# Altium project P2_OBC-ADCS CubeSat - Copy.PrjPcb (part 2 of 2)

## Sheet  CAM_IF.SchDoc
size A4; SheetNumber: 5; SheetTotal: 9
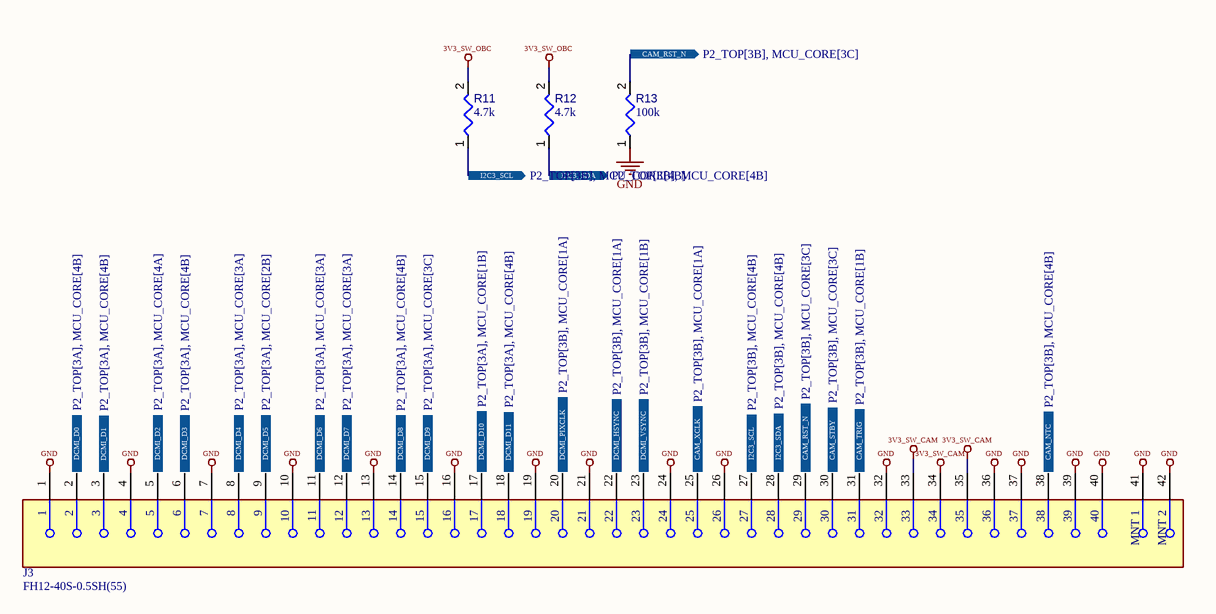
[diagram p4:  CAM_IF.SchDoc]

### Parts
J3  FH12-40S-0.5SH(55)  [FP-FH12-40S-0_5SH_55-MFG]
R11  value 4.7k  [RESC0402(1005)_L]  (hidden comment: Resistor 4K7  +/-1 % 0402 63 mW)
R12  value 4.7k  [RESC0402(1005)_L]  (hidden comment: Resistor 4K7  +/-1 % 0402 63 mW)
R13  value 100k  [RESC1005X40X25ML05T05]  (hidden comment: Resistor 100k +/-1% 0402 100 mW)

### Ports
CAM_NTC (out, see P2_TOP[3B], MCU_CORE[4B]), CAM_RST_N (out, see P2_TOP[3B], MCU_CORE[3C]), CAM_STBY (out, see P2_TOP[3B], MCU_CORE[3C]), CAM_TRIG (out, see P2_TOP[3B], MCU_CORE[1B]), CAM_XCLK (out, see P2_TOP[3B], MCU_CORE[1A]), DCMI_D0 (out, see P2_TOP[3A], MCU_CORE[4B]), DCMI_D1 (out, see P2_TOP[3A], MCU_CORE[4B]), DCMI_D2 (out, see P2_TOP[3A], MCU_CORE[4A]), DCMI_D3 (out, see P2_TOP[3A], MCU_CORE[4B]), DCMI_D4 (out, see P2_TOP[3A], MCU_CORE[3A]), DCMI_D5 (out, see P2_TOP[3A], MCU_CORE[2B]), DCMI_D6 (out, see P2_TOP[3A], MCU_CORE[3A]), DCMI_D7 (out, see P2_TOP[3A], MCU_CORE[3A]), DCMI_D8 (out, see P2_TOP[3A], MCU_CORE[4B]), DCMI_D9 (out, see P2_TOP[3A], MCU_CORE[3C]), DCMI_D10 (out, see P2_TOP[3A], MCU_CORE[1B]), DCMI_D11 (out, see P2_TOP[3A], MCU_CORE[4B]), DCMI_HSYNC (out, see P2_TOP[3B], MCU_CORE[1A]), DCMI_PIXCLK (out, see P2_TOP[3B], MCU_CORE[1A]), DCMI_VSYNC (out, see P2_TOP[3B], MCU_CORE[1B]), I2C3_SCL (out, see P2_TOP[3B], MCU_CORE[4B]), I2C3_SDA (out, see P2_TOP[3B], MCU_CORE[4B])

### Nets
3V3_SW_CAM: J3.33 J3.34 J3.35
3V3_SW_OBC: R11.2 R12.2
GND: J3.1 J3.4 J3.7 J3.10 J3.13 J3.16 J3.19 J3.21 J3.24 J3.26 J3.32 J3.36 J3.37 J3.39 J3.40 J3.41(MNT_1) J3.42(MNT_2) R13.1
NetJ3_2: J3.2 ; port DCMI_D0
NetJ3_3: J3.3 ; port DCMI_D1
NetJ3_5: J3.5 ; port DCMI_D2
NetJ3_6: J3.6 ; port DCMI_D3
NetJ3_8: J3.8 ; port DCMI_D4
NetJ3_9: J3.9 ; port DCMI_D5
NetJ3_11: J3.11 ; port DCMI_D6
NetJ3_12: J3.12 ; port DCMI_D7
NetJ3_14: J3.14 ; port DCMI_D8
NetJ3_15: J3.15 ; port DCMI_D9
NetJ3_17: J3.17 ; port DCMI_D10
NetJ3_18: J3.18 ; port DCMI_D11
NetJ3_20: J3.20 ; port DCMI_PIXCLK
NetJ3_22: J3.22 ; port DCMI_HSYNC
NetJ3_23: J3.23 ; port DCMI_VSYNC
NetJ3_25: J3.25 ; port CAM_XCLK
NetJ3_27: J3.27 R11.1 ; port I2C3_SCL
NetJ3_28: J3.28 R12.1 ; port I2C3_SDA
NetJ3_29: J3.29 R13.2 ; port CAM_RST_N
NetJ3_30: J3.30 ; port CAM_STBY
NetJ3_31: J3.31 ; port CAM_TRIG
NetJ3_38: J3.38 ; port CAM_NTC

### Library data of the parts
J3 = CMP-002-00080-1: FFC/FPC Connectors; FH12-40S-0.5SH(55); HIROSE ELECTRIC; 500 mA; Yes; Gold; 40; Connector Type: Receptacle; Number of Positions: 40; Current Rating: 500mA; Contact Resistance: 50mΩ; Max Voltage Rating (AC): 50V; Gender: Female; Pitch: 508µm; Contact Pitch: 500µm; Plating Thickness: 50.8nm; Dielectric Material: Polyamide; Insulation Resistance: 500MΩ; Actuator Material: Polyphenylene; Wire/Cable Type: Straight; Max Current Rating: 400mA; Contact Location: Bottom; Number of Rows: 1; Min Operating Temperature: -40°C; Termination: Solder; Terminal Pitch: 500µm; Lifecycle Status: Production; Max Operating Temperature: 85°C; RoHS: Compliant; Contact Material: Gold, Nickel; Flammability Rating: UL94 V-0; Pins: 40; Lead Free: Lead Free; Mounting Technology: Surface Mount; Contact Voltage Rating (AC): 50V; Height: 2mm; Voltage Rating: 50V; Housing Color: Brown; Voltage Rating (AC): 50V; Orientation: Right Angle; Packaging: Cut Tape; Contact Plating: Gold; Color: Beige, Brown; Width: 6.4mm; REACH SVHC: Unaffected; Insulation Material: Nylon; Length: 24.1mm; Depth: 5.6mm; Lead Pitch: 500µm; Number of Contacts: 40
R11 R12 = CMP-009-00158-3: Chip Resistor, 4,7 kOhms, +/-1 %, 63 mW, -55 to 155 degC, 0402; Power: 63mW; Tolerance: 1%; Max Operating Temperature: 155°C; Pins: 2; Min Operating Temperature: -55°C; Case/Package: 0402
R13 = CMP-009-00022-5: Chip Resistor, 100 KOhm, +/- 1%, 0.1 W, -55 to 155 degC, 0402 (1005 Metric); Power: 100mW; Voltage Rating: 50V; Mounting Technology: SM; Pins: 2; Min Operating Temperature: -55°C; Tolerance: 1%; RoHS Compliant: True; Case/Package: 0402; Max Operating Temperature: 155°C

## Sheet  ADCS_SENS.SchDoc
size A4; SheetNumber: 6; SheetTotal: 9
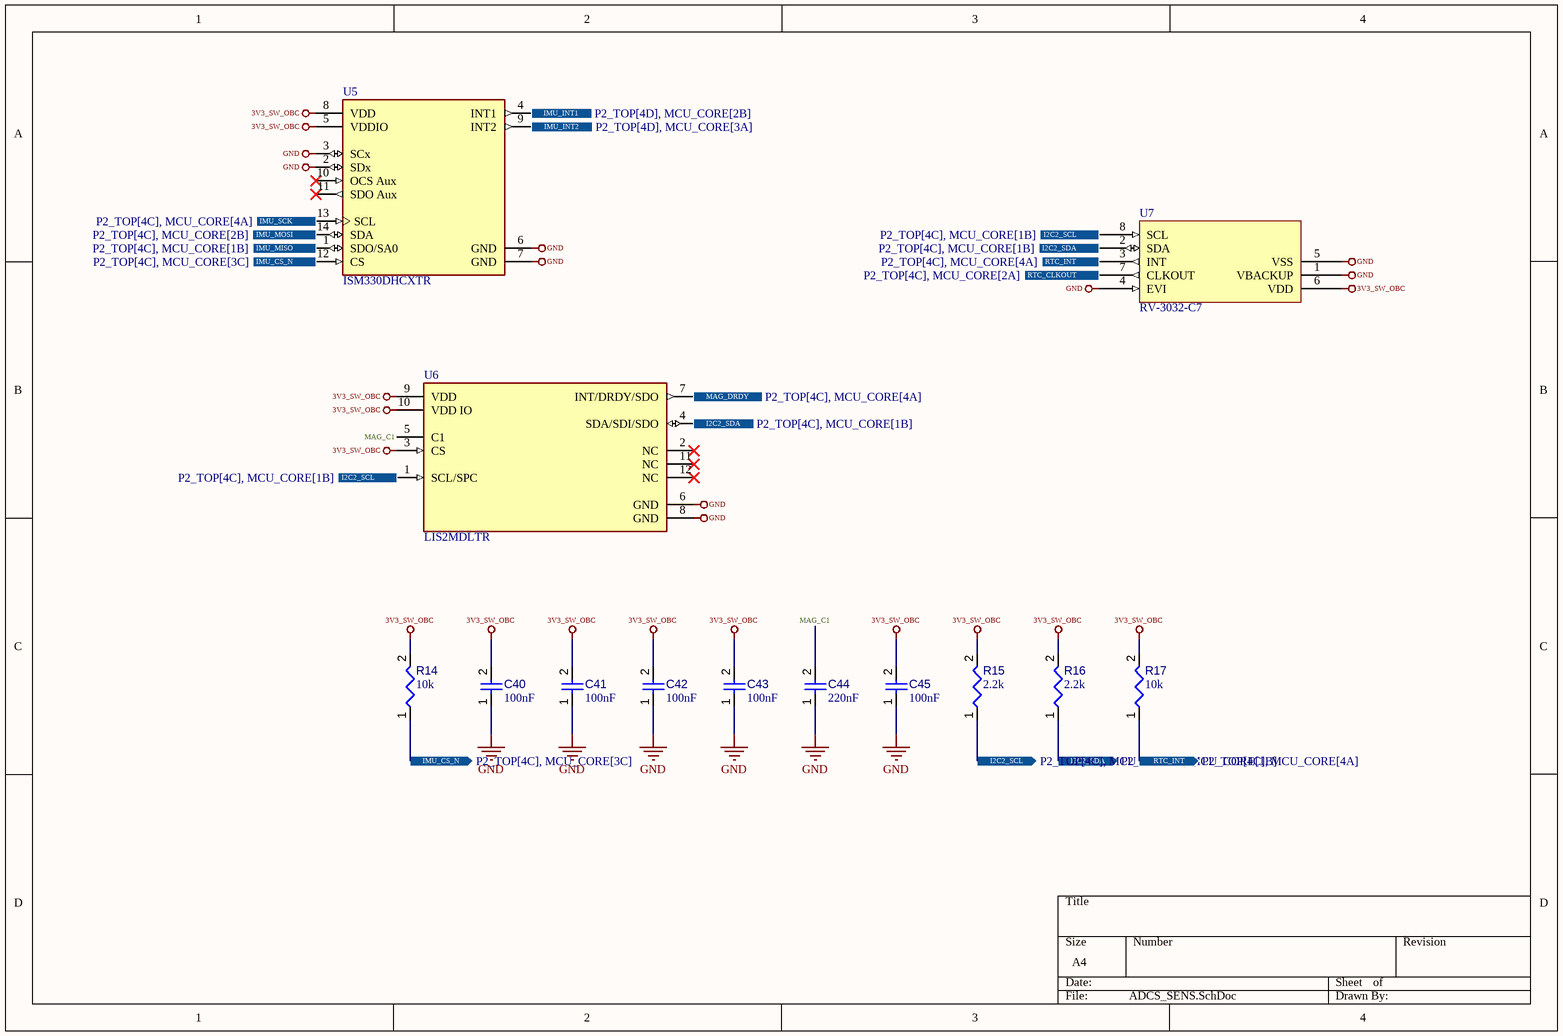
[diagram p5:  ADCS_SENS.SchDoc]

### Parts
C40  value 100nF  [CAPC0402(1005)60_L]  (hidden comment: Capacitor 100nF +/-20% 10V 0402)
C41  value 100nF  [CAPC0402(1005)60_L]  (hidden comment: Capacitor 100nF +/-20% 10V 0402)
C42  value 100nF  [CAPC0402(1005)60_L]  (hidden comment: Capacitor 100nF +/-20% 10V 0402)
C43  value 100nF  [CAPC0402(1005)60_L]  (hidden comment: Capacitor 100nF +/-20% 10V 0402)
C44  value 220nF  [CAPC0402(1005)60_L]  (hidden comment: Capacitor 220nF +/-20% 10V 0402)
C45  value 100nF  [CAPC0402(1005)60_L]  (hidden comment: Capacitor 100nF +/-20% 10V 0402)
R14  value 10k  [RESC1005X40X25ML05T05]  (hidden comment: Resistor 10k +/-1% 0402 63 mW)
R15  value 2.2k  [RESC0402(1005)_L]  (hidden comment: Resistor 2K2  +/-5 % 0402 63 mW)
R16  value 2.2k  [RESC0402(1005)_L]  (hidden comment: Resistor 2K2  +/-5 % 0402 63 mW)
R17  value 10k  [RESC1005X40X25ML05T05]  (hidden comment: Resistor 10k +/-1% 0402 63 mW)
U5  ISM330DHCXTR  [FP-LGA-14L-DM00249496-MFG]
U6  LIS2MDLTR  [FP-LGA-12-DM00170568-MFG]
U7  RV-3032-C7  [RV-3032-C7-Footprint-1]

### Ports
I2C2_SCL (out, see P2_TOP[4C], MCU_CORE[1B]), I2C2_SDA (out, see P2_TOP[4C], MCU_CORE[1B]), IMU_CS_N (out, see P2_TOP[4C], MCU_CORE[3C]), IMU_INT1 (out, see P2_TOP[4D], MCU_CORE[2B]), IMU_INT2 (out, see P2_TOP[4D], MCU_CORE[3A]), IMU_MISO (out, see P2_TOP[4C], MCU_CORE[1B]), IMU_MOSI (out, see P2_TOP[4C], MCU_CORE[2B]), IMU_SCK (out, see P2_TOP[4C], MCU_CORE[4A]), MAG_DRDY (out, see P2_TOP[4C], MCU_CORE[4A]), RTC_CLKOUT (out, see P2_TOP[4C], MCU_CORE[2A]), RTC_INT (out, see P2_TOP[4C], MCU_CORE[4A])

### Nets
3V3_SW_OBC: C40.2 C41.2 C42.2 C43.2 C45.2 R14.2 R15.2 R16.2 R17.2 U5.5(VDDIO) U5.8(VDD) U6.3(CS) U6.9(VDD) U6.10(VDD_IO) U7.6(VDD)
GND: C40.1 C41.1 C42.1 C43.1 C44.1 C45.1 U5.2(SDx) U5.3(SCx) U5.6(GND) U5.7(GND) U6.6(GND) U6.8(GND) U7.1(VBACKUP) U7.4(EVI) U7.5(VSS)
MAG_C1: C44.2 U6.5(C1)
NetR14_1: R14.1 U5.12(CS) ; port IMU_CS_N
NetR15_1: R15.1 U6.1(SCL/SPC) U7.8(SCL) ; port I2C2_SCL
NetR16_1: R16.1 U6.4(SDA/SDI/SDO) U7.2(SDA) ; port I2C2_SDA
NetR17_1: R17.1 U7.3(INT) ; port RTC_INT
NetU5_1: U5.1(SDO/SA0) ; port IMU_MISO
NetU5_4: U5.4(INT1) ; port IMU_INT1
NetU5_9: U5.9(INT2) ; port IMU_INT2
NetU5_13: U5.13(SCL) ; port IMU_SCK
NetU5_14: U5.14(SDA) ; port IMU_MOSI
NetU6_7: U6.7(INT/DRDY/SDO) ; port MAG_DRDY
NetU7_7: U7.7(CLKOUT) ; port RTC_CLKOUT

Not connected (* = marked no-connect by the designer): U5 10(OCS_Aux)* 11(SDO_Aux)*; U6 2(NC)* 11(NC)* 12(NC)*

### Library data of the parts
C40-C43 C45 = CMP-001-00061-3: Chip Capacitor, 100nF +/-20%, 10V, 0402, Thickness 0.6 mm; Tolerance: 20%; Mounting Technology: SMT; Voltage Rating: 10V; Max Operating Temperature: 85°C; Pins: 2; Case/Package: 0402; Min Operating Temperature: -55°C
C44 = CMP-001-00057-3: Chip Capacitor, 220nF +/-20%, 10V, 0402, Thickness 0.6 mm; Tolerance: 10%; Max Operating Temperature: 85°C; Pins: 2; Case/Package: 0402; Mounting Technology: SMT; Voltage Rating: 10V; Min Operating Temperature: -55°C
R14 R17 = CMP-009-00019-5: Chip Resistor, 10 KOhm, +/- 1%, 63 mW, -55 to 155 degC, 0402 (1005 Metric); Power: 63mW; Voltage Rating: 50V; Case/Package: 0402; Mounting Technology: SM; Pins: 2; Min Operating Temperature: -55°C; Tolerance: 1%; RoHS Compliant: True; Max Operating Temperature: 155°C
R15 R16 = CMP-009-00166-3: Chip Resistor, 2,2 kOhms, +/-5 %, 63 mW, -55 to 155 degC, 0402; Power: 63mW; Tolerance: 5%; Pins: 2; Min Operating Temperature: -55°C; Max Operating Temperature: 155°C; Case/Package: 0402
U5 = CMP-010-00024-2: MEMS Module, Tri-Axis Gyroscope, Tri-Axis Accelerometer, 1.71 V, 3.6 V, LGA, 14 Pins; Output Configuration: Digital; Max Supply Voltage: 3.6V; Min Supply Voltage: 1.71V; Operating Supply Voltage: 1.8V; RoHS: Compliant; Lifecycle Status: Production; REACH SVHC: Unaffected; Output Type: Digital; Max Operating Temperature: 105°C; Min Operating Temperature: -40°C; Length: 3mm; Number of Terminals: 14; Country of Origin: Philippines; Mounting Technology: Surface Mount; China RoHS: Non-Compliant; Export Control Classification Number (ECCN) Code: EAR99; Height: 860µm; Introduction Date: 2019-07-31
U6 = CMP-010-00026-2: LIS2MDL Series 3.6V 50 Hz High Performance 3-Axis Digital Magnetic Sensor-LGA-12; Manufacturer Package Identifier: LGA-12-DM00170568; Axis: X, Y, Z; Operating Supply Voltage: 2.5V; Current Rating: 200µA; Min Supply Voltage: 1.71V; Min Operating Temperature: -40°C; Output Type: Digital; Max Supply Voltage: 3.6V; Country of Origin: Malta; Height: 700µm; Termination: Solder; Schedule B: 8542390000, 8542390000; Length: 2mm; Mounting Technology: Surface Mount; Export Control Classification Number (ECCN) Code: EAR99; Max Operating Temperature: 85°C; Introduction Date: 2017-05-12; China RoHS: Compliant; Sensing Method: Magnetic; Number of Terminals: 12; RoHS: Compliant; REACH SVHC: Unaffected; Lifecycle Status: Production
U7 = CMP-003-00032-2: Real Time Clock, Non-Volatile, 0 Timer(s), CMOS, CDSO8; Min Supply Voltage: 1.3V; Number of Timers/Counters: 0; Body Material: Ceramic; Nominal Supply Voltage (DC): 3V; Max Supply Voltage: 5.5V; Max Operating Temperature: 85°C; Length: 3.2mm; Height - Seated (Max): 800µm; Contact Plating: Gold; Lifecycle Status: Production; Ratings: AEC-Q200; China RoHS: Compliant; Terminal Pitch: 900µm; Width: 1.5mm; Number of Terminals: 8; RoHS: Compliant; REACH SVHC: Unaffected; Min Operating Temperature: -40°C

## Sheet  BUS_IF.SchDoc
size A4; SheetNumber: 7; SheetTotal: 9
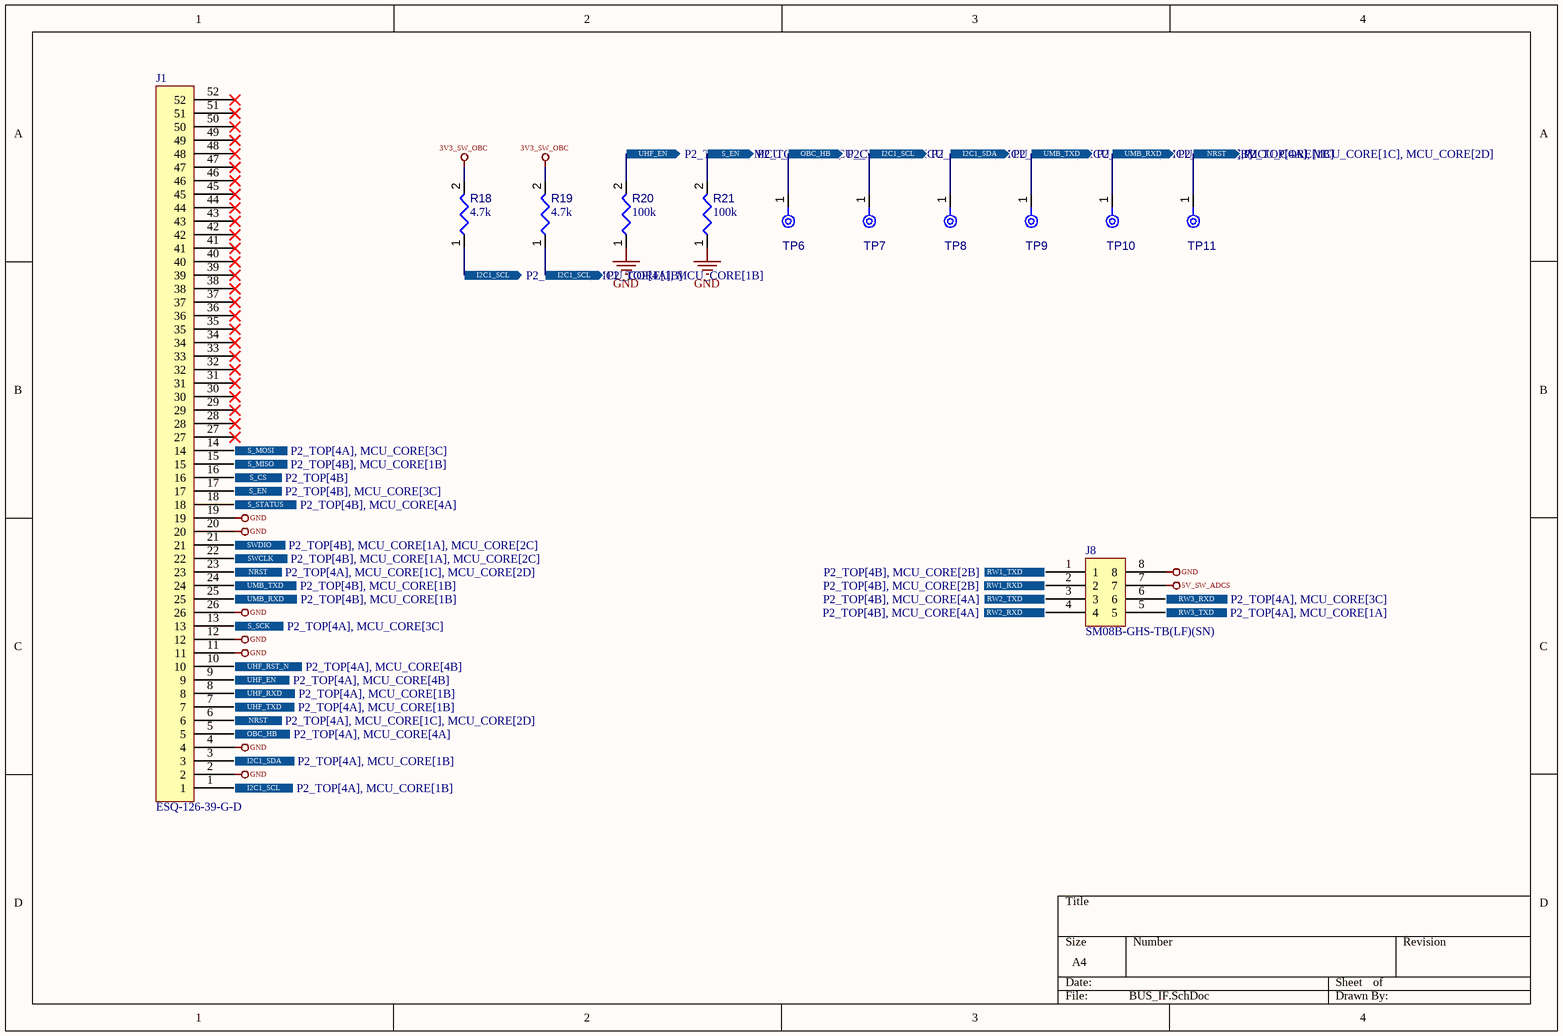
[diagram p6:  BUS_IF.SchDoc]

### Parts
(Parts that share a designator on the sheet are numbered #1, #2 ... from top to bottom, then left to right.)
J1#1  ESQ-126-39-G-D  [CONN_ESQ-126-39-G-D_SAI]
J8  SM08B-GHS-TB(LF)(SN)
R18  value 4.7k  [RESC0402(1005)_L]  (hidden comment: Resistor 4K7  +/-1 % 0402 63 mW)
R19  value 4.7k  [RESC0402(1005)_L]  (hidden comment: Resistor 4K7  +/-1 % 0402 63 mW)
R20  value 100k  [RESC0402(1005)_L]  (hidden comment: 100KR2F)
R21  value 100k  [RESC0402(1005)_L]  (hidden comment: 100KR2F)
TP6  TPAD6R  [TP06R]  (value not drawn)  (no BOM)
TP7  TPAD6R  [TP06R]  (value not drawn)  (no BOM)
TP8  TPAD6R  [TP06R]  (value not drawn)  (no BOM)
TP9  TPAD6R  [TP06R]  (value not drawn)  (no BOM)
TP10  TPAD6R  [TP06R]  (value not drawn)  (no BOM)
TP11  TPAD6R  [TP06R]  (value not drawn)  (no BOM)

### Ports
I2C1_SCL (out, see P2_TOP[4A], MCU_CORE[1B]), I2C1_SDA (out, see P2_TOP[4A], MCU_CORE[1B]), NRST (out, see P2_TOP[4A], MCU_CORE[1C], MCU_CORE[2D]), OBC_HB (out, see P2_TOP[4A], MCU_CORE[4A]), RW1_RXD (out, see P2_TOP[4B], MCU_CORE[2B]), RW1_TXD (out, see P2_TOP[4B], MCU_CORE[2B]), RW2_RXD (out, see P2_TOP[4B], MCU_CORE[4A]), RW2_TXD (out, see P2_TOP[4B], MCU_CORE[4A]), RW3_RXD (out, see P2_TOP[4A], MCU_CORE[3C]), RW3_TXD (out, see P2_TOP[4A], MCU_CORE[1A]), S_CS (out, see P2_TOP[4B]), S_EN (out, see P2_TOP[4B], MCU_CORE[3C]), S_MISO (out, see P2_TOP[4B], MCU_CORE[1B]), S_MOSI (out, see P2_TOP[4A], MCU_CORE[3C]), S_SCK (out, see P2_TOP[4A], MCU_CORE[3C]), S_STATUS (out, see P2_TOP[4B], MCU_CORE[4A]), SWCLK (out, see P2_TOP[4B], MCU_CORE[1A], MCU_CORE[2C]), SWDIO (out, see P2_TOP[4B], MCU_CORE[1A], MCU_CORE[2C]), UHF_EN (out, see P2_TOP[4A], MCU_CORE[4B]), UHF_RST_N (out, see P2_TOP[4A], MCU_CORE[4B]), UHF_RXD (out, see P2_TOP[4A], MCU_CORE[1B]), UHF_TXD (out, see P2_TOP[4A], MCU_CORE[1B]), UMB_RXD (out, see P2_TOP[4B], MCU_CORE[1B]), UMB_TXD (out, see P2_TOP[4B], MCU_CORE[1B])

### Nets
3V3_SW_OBC: R18.2 R19.2
5V_SW_ADCS: J8.7
GND: J1#1.2 J1#1.4 J1#1.11 J1#1.12 J1#1.19 J1#1.20 J1#1.26 J8.8 R20.1 R21.1
NetJ1#1_1: J1#1.1 R18.1 R19.1 TP7.1(TP) ; port I2C1_SCL
NetJ1#1_3: J1#1.3 TP8.1(TP) ; port I2C1_SDA
NetJ1#1_5: J1#1.5 TP6.1(TP) ; port OBC_HB
NetJ1#1_6: J1#1.6 J1#1.23 TP11.1(TP) ; port NRST
NetJ1#1_7: J1#1.7 ; port UHF_TXD
NetJ1#1_8: J1#1.8 ; port UHF_RXD
NetJ1#1_9: J1#1.9 R20.2 ; port UHF_EN
NetJ1#1_10: J1#1.10 ; port UHF_RST_N
NetJ1#1_13: J1#1.13 ; port S_SCK
NetJ1#1_14: J1#1.14 ; port S_MOSI
NetJ1#1_15: J1#1.15 ; port S_MISO
NetJ1#1_16: J1#1.16 ; port S_CS
NetJ1#1_17: J1#1.17 R21.2 ; port S_EN
NetJ1#1_18: J1#1.18 ; port S_STATUS
NetJ1#1_21: J1#1.21 ; port SWDIO
NetJ1#1_22: J1#1.22 ; port SWCLK
NetJ1#1_24: J1#1.24 TP9.1(TP) ; port UMB_TXD
NetJ1#1_25: J1#1.25 TP10.1(TP) ; port UMB_RXD
NetJ8_1: J8.1 ; port RW1_TXD
NetJ8_2: J8.2 ; port RW1_RXD
NetJ8_3: J8.3 ; port RW2_TXD
NetJ8_4: J8.4 ; port RW2_RXD
NetJ8_5: J8.5 ; port RW3_TXD
NetJ8_6: J8.6 ; port RW3_RXD

Not connected (* = marked no-connect by the designer): J1#1 27* 28* 29* 30* 31* 32* 33* 34* 35* 36* 37* 38* 39* 40* 41* 42* 43* 44* 45* 46* 47* 48* 49* 50* 51* 52*

### Library data of the parts
J1#1 = CMP-002-00077-3: Samtec ESQ Series, 2.54mm Pitch, 52-Pin Double Row Receptacle, Board-to-Board, Right Angle, TH; Manufacturer Lifecycle Status: PRODUCTION; Max Voltage Rating (AC): 550V; Contact Resistance: 10mΩ; Number of Contacts: 52; Max Current Rating: 6.9A; Housing Color: Black; Max Operating Temperature: 125°C; Depth: 4.95mm; Radiation Hardening: No; RoHS: Compliant; Housing Material: Polyester; Pitch: 2.54mm; Number of Rows: 2; Orientation: Straight; Length: 66.55mm; Lifecycle Status: Production; Packaging: Bulk; Contact Plating: Gold; Termination: Solder; Pins: 52; Min Operating Temperature: -55°C; Contact Material: Bronze
J8 = CMP-002-00081-2: Connector Header Surface Mount, Right Angle 8 position 0.049" (1.25mm); Voltage Rating: 50V; Contact Resistance: 50mΩ; Gender: Male; Number of Contacts: 8; Current Rating: 1A; Pitch: 1.2446mm; Insulation Resistance: 100MΩ; Connector Type: Male Pin, Outer Shroud Contact; Dielectric Material: Polyamide; Orientation: Right Angle; Max Operating Temperature: 85°C; Contact Material: Copper, Tin; Contact Plating: Tin; Pins: 8; Lifecycle Status: Production; Min Operating Temperature: -25°C; Number of Rows: 1; Housing Color: Natural; REACH SVHC: Unaffected; Termination: Solder; Manufacturer Package Identifier: SM08B-GHS-TB(LF)(SN); Height: 4.35mm; Housing Material: Nylon; Fastening Type: Latch, Ramp; Number of Positions: 8; RoHS: Compliant; Lead Free: Lead Free; Terminal Pitch: 1.25mm; Color: Natural; Mounting Technology: Surface Mount
R18 R19 = CMP-009-00158-3: Chip Resistor, 4,7 kOhms, +/-1 %, 63 mW, -55 to 155 degC, 0402; Power: 63mW; Tolerance: 1%; Max Operating Temperature: 155°C; Pins: 2; Min Operating Temperature: -55°C; Case/Package: 0402
R20 R21 = CMP-009-00064-2: 100K 0.063W 1% 0402 (1005 Metric)  SMD; Power: 63mW; Case/Package: 0402; Mounting Technology: SMT; Pins: 2; Tolerance: 1%
TP6-TP11 = CMP-00028-00002-2: 0.6mm round; Pins: 1

## Sheet  MTQ_CH.SchDoc
size A4; SheetNumber: 8; SheetTotal: 9
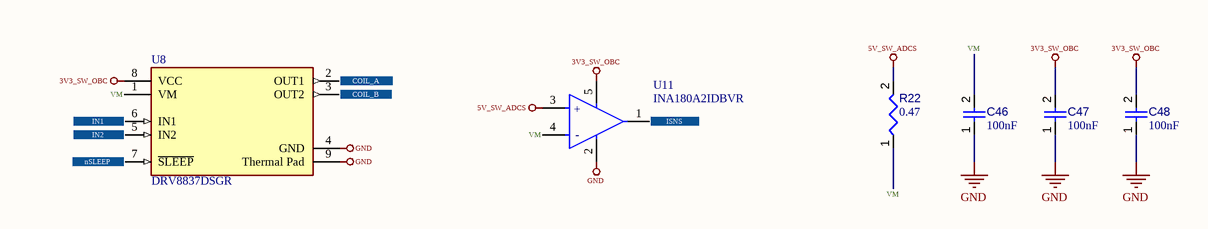
[diagram p7:  MTQ_CH.SchDoc]

### Parts
C46  value 100nF  [CAPC0402(1005)60_L]  (hidden comment: Capacitor 100nF +/-20% 25V 0402)
C47  value 100nF  [CAPC0402(1005)60_L]  (hidden comment: Capacitor 100nF +/-20% 25V 0402)
C48  value 100nF  [CAPC0402(1005)60_L]  (hidden comment: Capacitor 100nF +/-20% 25V 0402)
R22  value 0.47  [RESC1608X55X25ML10T15]  (hidden comment: Resistor 4k7 +/-1% 0603 100 mW)
U8  DRV8837DSGR  [FP-DSG0008A-IPC_A]
U11  INA180A2IDBVR  [FP-DBV0005A-IPC_B]

### Ports
COIL_A (out), COIL_B (out), IN1 (out), IN2 (out), ISNS (out), nSLEEP (out)

### Nets
3V3_SW_OBC: C47.2 C48.2 U8.8(VCC) U11.5(VS)
5V_SW_ADCS: R22.2 U11.3(IN+)
GND: C46.1 C47.1 C48.1 U8.4(GND) U8.9(Thermal_Pad) U11.2(GND)
VM: C46.2 R22.1 U8.1(VM) U11.4(IN-)
NetU8_2: U8.2(OUT1) ; port COIL_A
NetU8_3: U8.3(OUT2) ; port COIL_B
NetU8_5: U8.5(IN2) ; port IN2
NetU8_6: U8.6(IN1) ; port IN1
NetU8_7: U8.7(~{SLEEP}) ; port nSLEEP
NetU11_1: U11.1(OUT) ; port ISNS

### Library data of the parts
C46-C48 = CMP-001-00065-4: Chip Capacitor, 100nF +/-20%, 25V, 0402, Thickness 0.6 mm; Tolerance: 10%; Max Operating Temperature: 85°C; Min Operating Temperature: -55°C; Pins: 2; Voltage Rating: 25V; Mounting Technology: SMT; Case/Package: 0402
R22 = CMP-009-00031-5: Chip Resistor, 4.7 KOhm, +/- 1%, 0.1 W, -55 to 155 degC, 0603 (1608 Metric); Power: 100mW; Tolerance: 1%; Mounting Technology: SM; Case/Package: 0603; RoHS Compliant: True; Pins: 2; Min Operating Temperature: -55°C; Max Operating Temperature: 155°C
U8 = CMP-00024-00006-1: 12-V, 1.8-A H-bridge motor driver 8-WSON -40 to 85; Manufacturer Lifecycle Status: ACTIVE; Max Output current: 1.8A; Motor Type: Brushed; Number of Outputs: 2; Number of Channels: 1; Nominal Supply Current: 300µA; Fault Protection: Over Temperature, Short Circuit; Max Supply Voltage: 7V; Max Junction Temperature (Tj): 150°C; Min Supply Voltage: 1.8V; Pins: 8; Thickness: 750µm; Mounting Technology: Surface Mount; Min Operating Temperature: -40°C; Type: Integrated Circuit (IC); Schedule B: 8542390000, 8542390000; REACH SVHC: Unaffected; Height: 800µm; RoHS: Compliant; Output Current: 1.8A; Length: 2mm; Ambient Temperature Range High: 85°C; Lifecycle Status: Production; Lead Free: Lead Free; Max Operating Temperature: 85°C; Radiation Hardening: No; Width: 2mm
U11 = CMP-014-00002-1: IC CURR SENSE 1 CIRCUIT SOT23-5 / Current Sense Amplifier 1 Circuit Rail-to-Rail SOT-23-5; Manufacturer Lifecycle Status: ACTIVE; Nominal Supply Current: 197µA; Number of Channels: 1; Max Junction Temperature (Tj): 150°C; Input Bias Current: 80µA; Input Offset Voltage (Vos): 100µV; Bandwidth: 210kHz; Max Supply Voltage: 5.5V; Min Supply Voltage: 2.7V; Output Current per Channel: 8mA; Min Operating Temperature: -40°C; Width: 1.6mm; Thickness: 1.2mm; Schedule B: 8542330000, 8542330000; Height: 1.45mm; Case/Package: SOT-23; Ambient Temperature Range High: 125°C; RoHS: Compliant; Pins: 5; Lifecycle Status: Production; Length: 2.9mm; Max Operating Temperature: 125°C

## Sheet  PANEL_CH.SchDoc
size A4; SheetNumber: 9; SheetTotal: 9
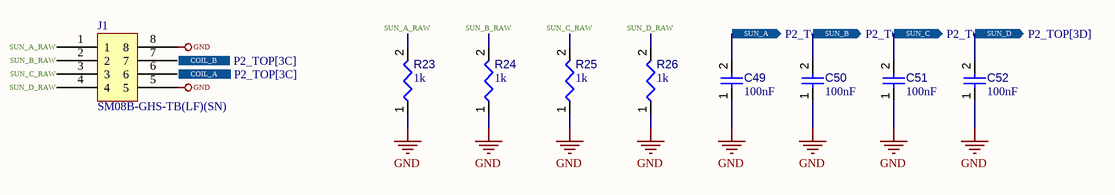
[diagram p8:  PANEL_CH.SchDoc]

### Parts
(Parts that share a designator on the sheet are numbered #1, #2 ... from top to bottom, then left to right.)
C49  value 100nF  [CAPC0402(1005)60_L]  (hidden comment: Capacitor 100nF +/-20% 25V 0402)
C50  value 100nF  [CAPC0402(1005)60_L]  (hidden comment: Capacitor 100nF +/-20% 25V 0402)
C51  value 100nF  [CAPC0402(1005)60_L]  (hidden comment: Capacitor 100nF +/-20% 25V 0402)
C52  value 100nF  [CAPC0402(1005)60_L]  (hidden comment: Capacitor 100nF +/-20% 25V 0402)
J1#2  SM08B-GHS-TB(LF)(SN)
R23  value 1k  [RESC0402(1005)_L]  (hidden comment: Resistor 1K +/-5 % 0402 63 mW)
R24  value 1k  [RESC0402(1005)_L]  (hidden comment: Resistor 1K +/-5 % 0402 63 mW)
R25  value 1k  [RESC0402(1005)_L]  (hidden comment: Resistor 1K +/-5 % 0402 63 mW)
R26  value 1k  [RESC0402(1005)_L]  (hidden comment: Resistor 1K +/-5 % 0402 63 mW)

### Ports
COIL_A (out, see P2_TOP[3C]), COIL_B (out, see P2_TOP[3C]), SUN_A (out, see P2_TOP[3C]), SUN_B (out, see P2_TOP[3D]), SUN_C (out, see P2_TOP[3D]), SUN_D (out, see P2_TOP[3D])

### Nets
GND: C49.1 C50.1 C51.1 C52.1 J1#2.5 J1#2.8 R23.1 R24.1 R25.1 R26.1
SUN_A_RAW: J1#2.1 R23.2
SUN_B_RAW: J1#2.2 R24.2
SUN_C_RAW: J1#2.3 R25.2
SUN_D_RAW: J1#2.4 R26.2
NetC49_2: C49.2 ; port SUN_A
NetC50_2: C50.2 ; port SUN_B
NetC51_2: C51.2 ; port SUN_C
NetC52_2: C52.2 ; port SUN_D
NetJ1#2_6: J1#2.6 ; port COIL_A
NetJ1#2_7: J1#2.7 ; port COIL_B

### Library data of the parts
C49-C52 = CMP-001-00065-4: as C46-C48 on sheet  MTQ_CH; Max Operating Temperature: 85°C; Min Operating Temperature: -55°C; Pins: 2; Voltage Rating: 25V; Mounting Technology: SMT; Case/Package: 0402
J1#2 = CMP-002-00081-2: as J8 on sheet  BUS_IF; Orientation: Right Angle; Max Operating Temperature: 85°C; Contact Material: Copper, Tin; Contact Plating: Tin; Pins: 8; Lifecycle Status: Production; Min Operating Temperature: -25°C; Number of Rows: 1; Housing Color: Natural; REACH SVHC: Unaffected; Termination: Solder; Manufacturer Package Identifier: SM08B-GHS-TB(LF)(SN); Height: 4.35mm; Housing Material: Nylon; Fastening Type: Latch, Ramp; Number of Positions: 8; RoHS: Compliant; Lead Free: Lead Free; Terminal Pitch: 1.25mm; Color: Natural; Mounting Technology: Surface Mount
R23-R26 = CMP-009-00157-3: Chip Resistor, 1 kOhms, +/-5 %, 63 mW, -55 to 155 degC, 0402; Tolerance: 5%; Power: 63mW; Case/Package: 0402; Pins: 2; Min Operating Temperature: -55°C; Max Operating Temperature: 155°C

## Nets that join several sheets
3V3_SW_CAM:  PWR_IN (C13.2 J2.7 J2.8 TP3.1),  CAM_IF (J3.33 J3.34 J3.35)
3V3_SW_OBC:  MEMORY (42 pins),  PWR_IN (5 pins),  MCU_CORE (35 pins),  CAM_IF (R11.2 R12.2),  ADCS_SENS (15 pins),  BUS_IF (R18.2 R19.2),  MTQ_CH (C47.2 C48.2 U8.8 U11.5)
5V_SW_ADCS:  PWR_IN (C14.2 J2.11 J2.12 TP2.1),  BUS_IF (J8.7),  MTQ_CH (R22.2 U11.3)
GND:  MEMORY (36 pins),  PWR_IN (13 pins),  MCU_CORE (45 pins),  CAM_IF (18 pins),  ADCS_SENS (15 pins),  BUS_IF (10 pins),  MTQ_CH (6 pins),  PANEL_CH (10 pins)